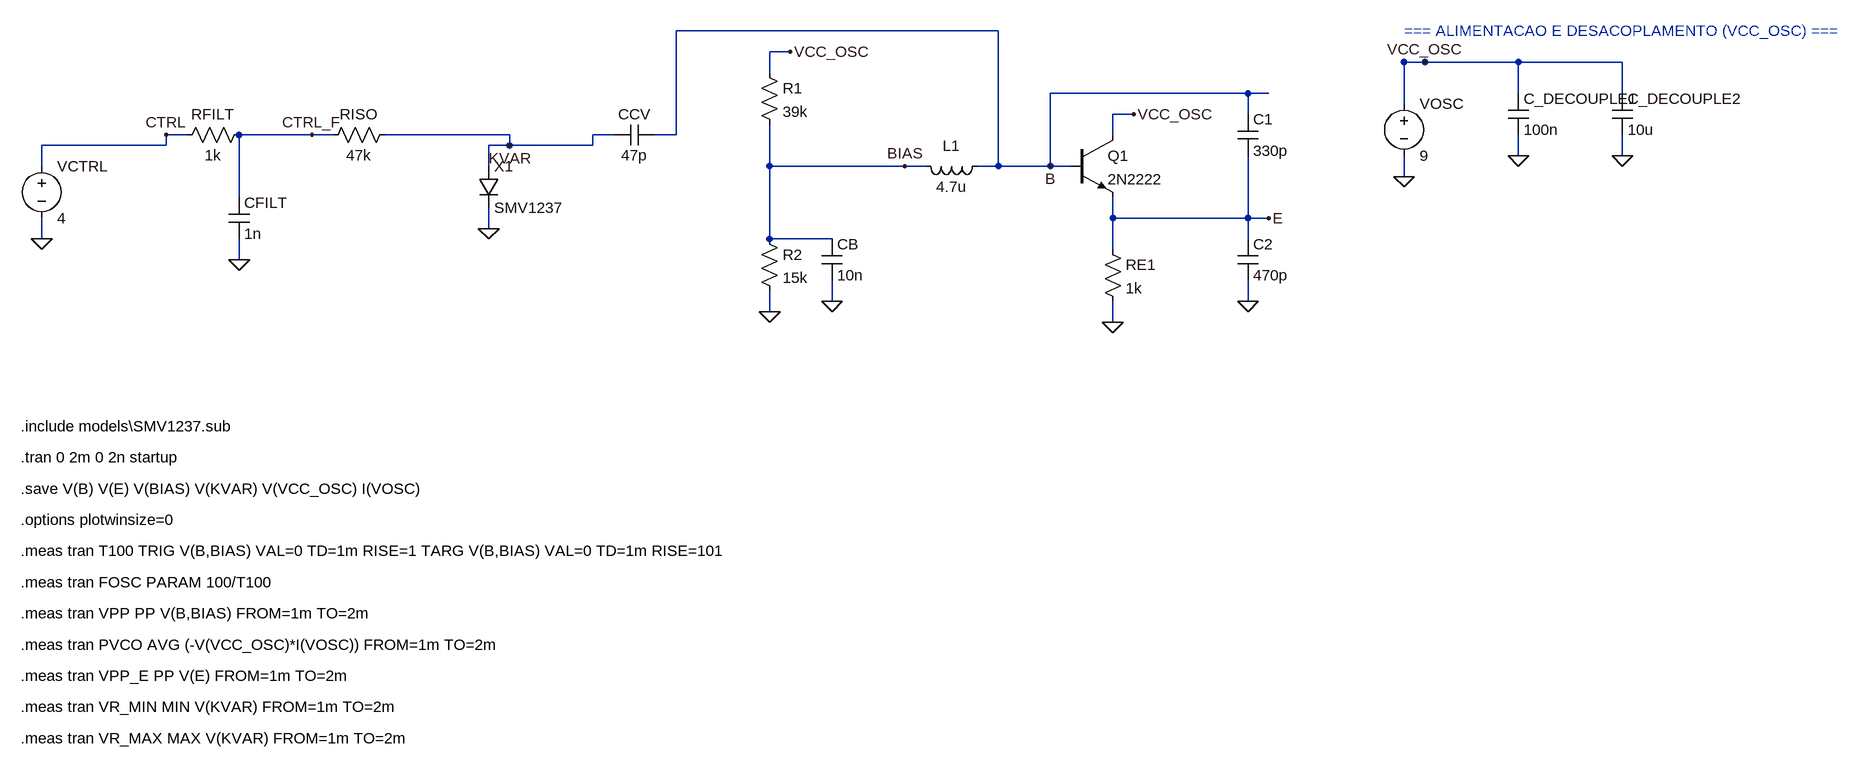
[diagram p0: schematic S2_S3_vco_nucleo.asc]
S2_S3_vco_nucleo.asc, the LTspice schematic file:
Version 4
SHEET 1 3456 1312
WIRE 96 368 96 400
WIRE 320 240 288 240
WIRE 400 240 400 336
WIRE 400 240 432 240
WIRE 400 400 400 432
WIRE 544 240 512 240
WIRE 624 240 656 240
WIRE 784 288 784 256
WIRE 784 256 816 256
WIRE 784 352 784 384
WIRE 976 240 944 240
WIRE 1040 240 1072 240
WIRE 1216 144 1216 112
WIRE 1216 112 1248 112
WIRE 1216 224 1216 400
WIRE 1216 288 1248 288
WIRE 1216 480 1216 512
WIRE 1216 400 1312 400
WIRE 1312 464 1312 496
WIRE 1456 288 1424 288
WIRE 1536 288 1568 288
WIRE 1680 288 1648 288
WIRE 1744 240 1744 208
WIRE 1744 208 1776 208
WIRE 1744 336 1744 416
WIRE 1744 368 1792 368
WIRE 1744 496 1744 528
WIRE 1952 208 1952 176
WIRE 1952 176 1984 176
WIRE 1952 272 1952 400
WIRE 1952 368 1984 368
WIRE 1952 464 1952 496
WIRE 2192 192 2192 128
WIRE 2192 272 2192 304
WIRE 2368 176 2368 128
WIRE 2368 240 2368 272
WIRE 2528 176 2528 128
WIRE 2528 240 2528 272
WIRE 2192 128 2528 128
WIRE 2192 128 2224 128
WIRE 96 288 96 256
WIRE 96 256 128 256
WIRE 432 240 512 240
WIRE 128 256 288 256
WIRE 288 256 288 240
WIRE 1248 288 1424 288
WIRE 1792 368 1984 368
WIRE 656 240 816 240
WIRE 816 240 816 256
WIRE 816 256 944 256
WIRE 944 256 944 240
WIRE 1072 240 1072 80
WIRE 1072 80 1568 80
WIRE 1568 80 1568 288
WIRE 1568 288 1648 288
WIRE 1648 288 1648 176
WIRE 1648 176 1984 176
FLAG 96 400 0
FLAG 288 240 CTRL
FLAG 400 432 0
FLAG 512 240 CTRL_F
FLAG 816 256 KVAR
FLAG 784 384 0
FLAG 1248 112 VCC_OSC
FLAG 1216 512 0
FLAG 1312 496 0
FLAG 1424 288 BIAS
FLAG 1648 288 B
FLAG 1776 208 VCC_OSC
FLAG 1744 528 0
FLAG 1984 368 E
FLAG 1952 496 0
FLAG 2192 304 0
FLAG 2368 272 0
FLAG 2528 272 0
FLAG 2224 128 VCC_OSC
SYMBOL voltage 96 272 R0
WINDOW 3 24 96 Left 2
SYMATTR InstName VCTRL
SYMATTR Value 4
SYMBOL res 416 224 R90
WINDOW 0 0 56 VBottom 2
WINDOW 3 32 56 VTop 2
SYMATTR InstName RFILT
SYMATTR Value 1k
SYMBOL cap 384 336 R0
SYMATTR InstName CFILT
SYMATTR Value 1n
SYMBOL res 640 224 R90
WINDOW 0 0 56 VBottom 2
WINDOW 3 32 56 VTop 2
SYMATTR InstName RISO
SYMATTR Value 47k
SYMBOL diode 768 288 R0
SYMATTR InstName X1
SYMATTR Value SMV1237
SYMATTR Prefix X
SYMBOL cap 1040 224 R90
WINDOW 0 0 32 VBottom 2
WINDOW 3 32 32 VTop 2
SYMATTR InstName CCV
SYMATTR Value 47p
SYMBOL res 1200 128 R0
SYMATTR InstName R1
SYMATTR Value 39k
SYMBOL res 1200 384 R0
SYMATTR InstName R2
SYMATTR Value 15k
SYMBOL cap 1296 400 R0
SYMATTR InstName CB
SYMATTR Value 10n
SYMBOL ind 1552 272 R90
WINDOW 0 0 56 VBottom 2
WINDOW 3 32 56 VTop 2
SYMATTR InstName L1
SYMATTR Value 4.7u
SYMATTR SpiceLine Rser=5.4
SYMBOL npn 1680 240 R0
SYMATTR InstName Q1
SYMATTR Value 2N2222
SYMBOL res 1728 400 R0
SYMATTR InstName RE1
SYMATTR Value 1k
SYMBOL cap 1936 208 R0
SYMATTR InstName C1
SYMATTR Value 330p
SYMBOL cap 1936 400 R0
SYMATTR InstName C2
SYMATTR Value 470p
SYMBOL voltage 2192 176 R0
WINDOW 3 24 96 Left 2
SYMATTR InstName VOSC
SYMATTR Value 9
SYMBOL cap 2352 176 R0
SYMATTR InstName C_DECOUPLE1
SYMATTR Value 100n
SYMBOL cap 2512 176 R0
SYMATTR InstName C_DECOUPLE2
SYMATTR Value 10u
TEXT 2192 80 Left 2 ;=== ALIMENTACAO E DESACOPLAMENTO (VCC_OSC) ===
TEXT 64 688 Left 2 !.include models\SMV1237.sub
TEXT 64 736 Left 2 !.tran 0 2m 0 2n startup
TEXT 64 784 Left 2 !.save V(B) V(E) V(BIAS) V(KVAR) V(VCC_OSC) I(VOSC)
TEXT 64 832 Left 2 !.options plotwinsize=0
TEXT 64 880 Left 2 !.meas tran T100 TRIG V(B,BIAS) VAL=0 TD=1m RISE=1 TARG V(B,BIAS) VAL=0 TD=1m RISE=101
TEXT 64 928 Left 2 !.meas tran FOSC PARAM 100/T100
TEXT 64 976 Left 2 !.meas tran VPP PP V(B,BIAS) FROM=1m TO=2m
TEXT 64 1024 Left 2 !.meas tran PVCO AVG (-V(VCC_OSC)*I(VOSC)) FROM=1m TO=2m
TEXT 64 1072 Left 2 !.meas tran VPP_E PP V(E) FROM=1m TO=2m
TEXT 64 1120 Left 2 !.meas tran VR_MIN MIN V(KVAR) FROM=1m TO=2m
TEXT 64 1168 Left 2 !.meas tran VR_MAX MAX V(KVAR) FROM=1m TO=2m

The netlist it stands for:
* S2_S3_vco_nucleo.asc
VCTRL CTRL 0 4
RFILT CTRL_F CTRL 1k
CFILT CTRL_F 0 1n
RISO KVAR CTRL_F 47k
XX1 KVAR 0 SMV1237  ; pins + -
CCV B KVAR 47p
R1 VCC_OSC BIAS 39k
R2 BIAS 0 15k
CB BIAS 0 10n
L1 B BIAS 4.7u Rser=5.4
Q1 VCC_OSC B E 0 2N2222
RE1 E 0 1k
C1 B E 330p
C2 E 0 470p
VOSC VCC_OSC 0 9
C_DECOUPLE1 VCC_OSC 0 100n
C_DECOUPLE2 VCC_OSC 0 10u
.model NPN NPN
.model PNP PNP
.lib standard.bjt
* === ALIMENTACAO E DESACOPLAMENTO (VCC_OSC) ===
.include models\SMV1237.sub
.tran 0 2m 0 2n startup
.save V(B) V(E) V(BIAS) V(KVAR) V(VCC_OSC) I(VOSC)
.options plotwinsize=0
.meas tran T100 TRIG V(B,BIAS) VAL=0 TD=1m RISE=1 TARG V(B,BIAS) VAL=0 TD=1m RISE=101
.meas tran FOSC PARAM 100/T100
.meas tran VPP PP V(B,BIAS) FROM=1m TO=2m
.meas tran PVCO AVG (-V(VCC_OSC)*I(VOSC)) FROM=1m TO=2m
.meas tran VPP_E PP V(E) FROM=1m TO=2m
.meas tran VR_MIN MIN V(KVAR) FROM=1m TO=2m
.meas tran VR_MAX MAX V(KVAR) FROM=1m TO=2m
.backanno
.end